# Altium project DAC.PrjPcb
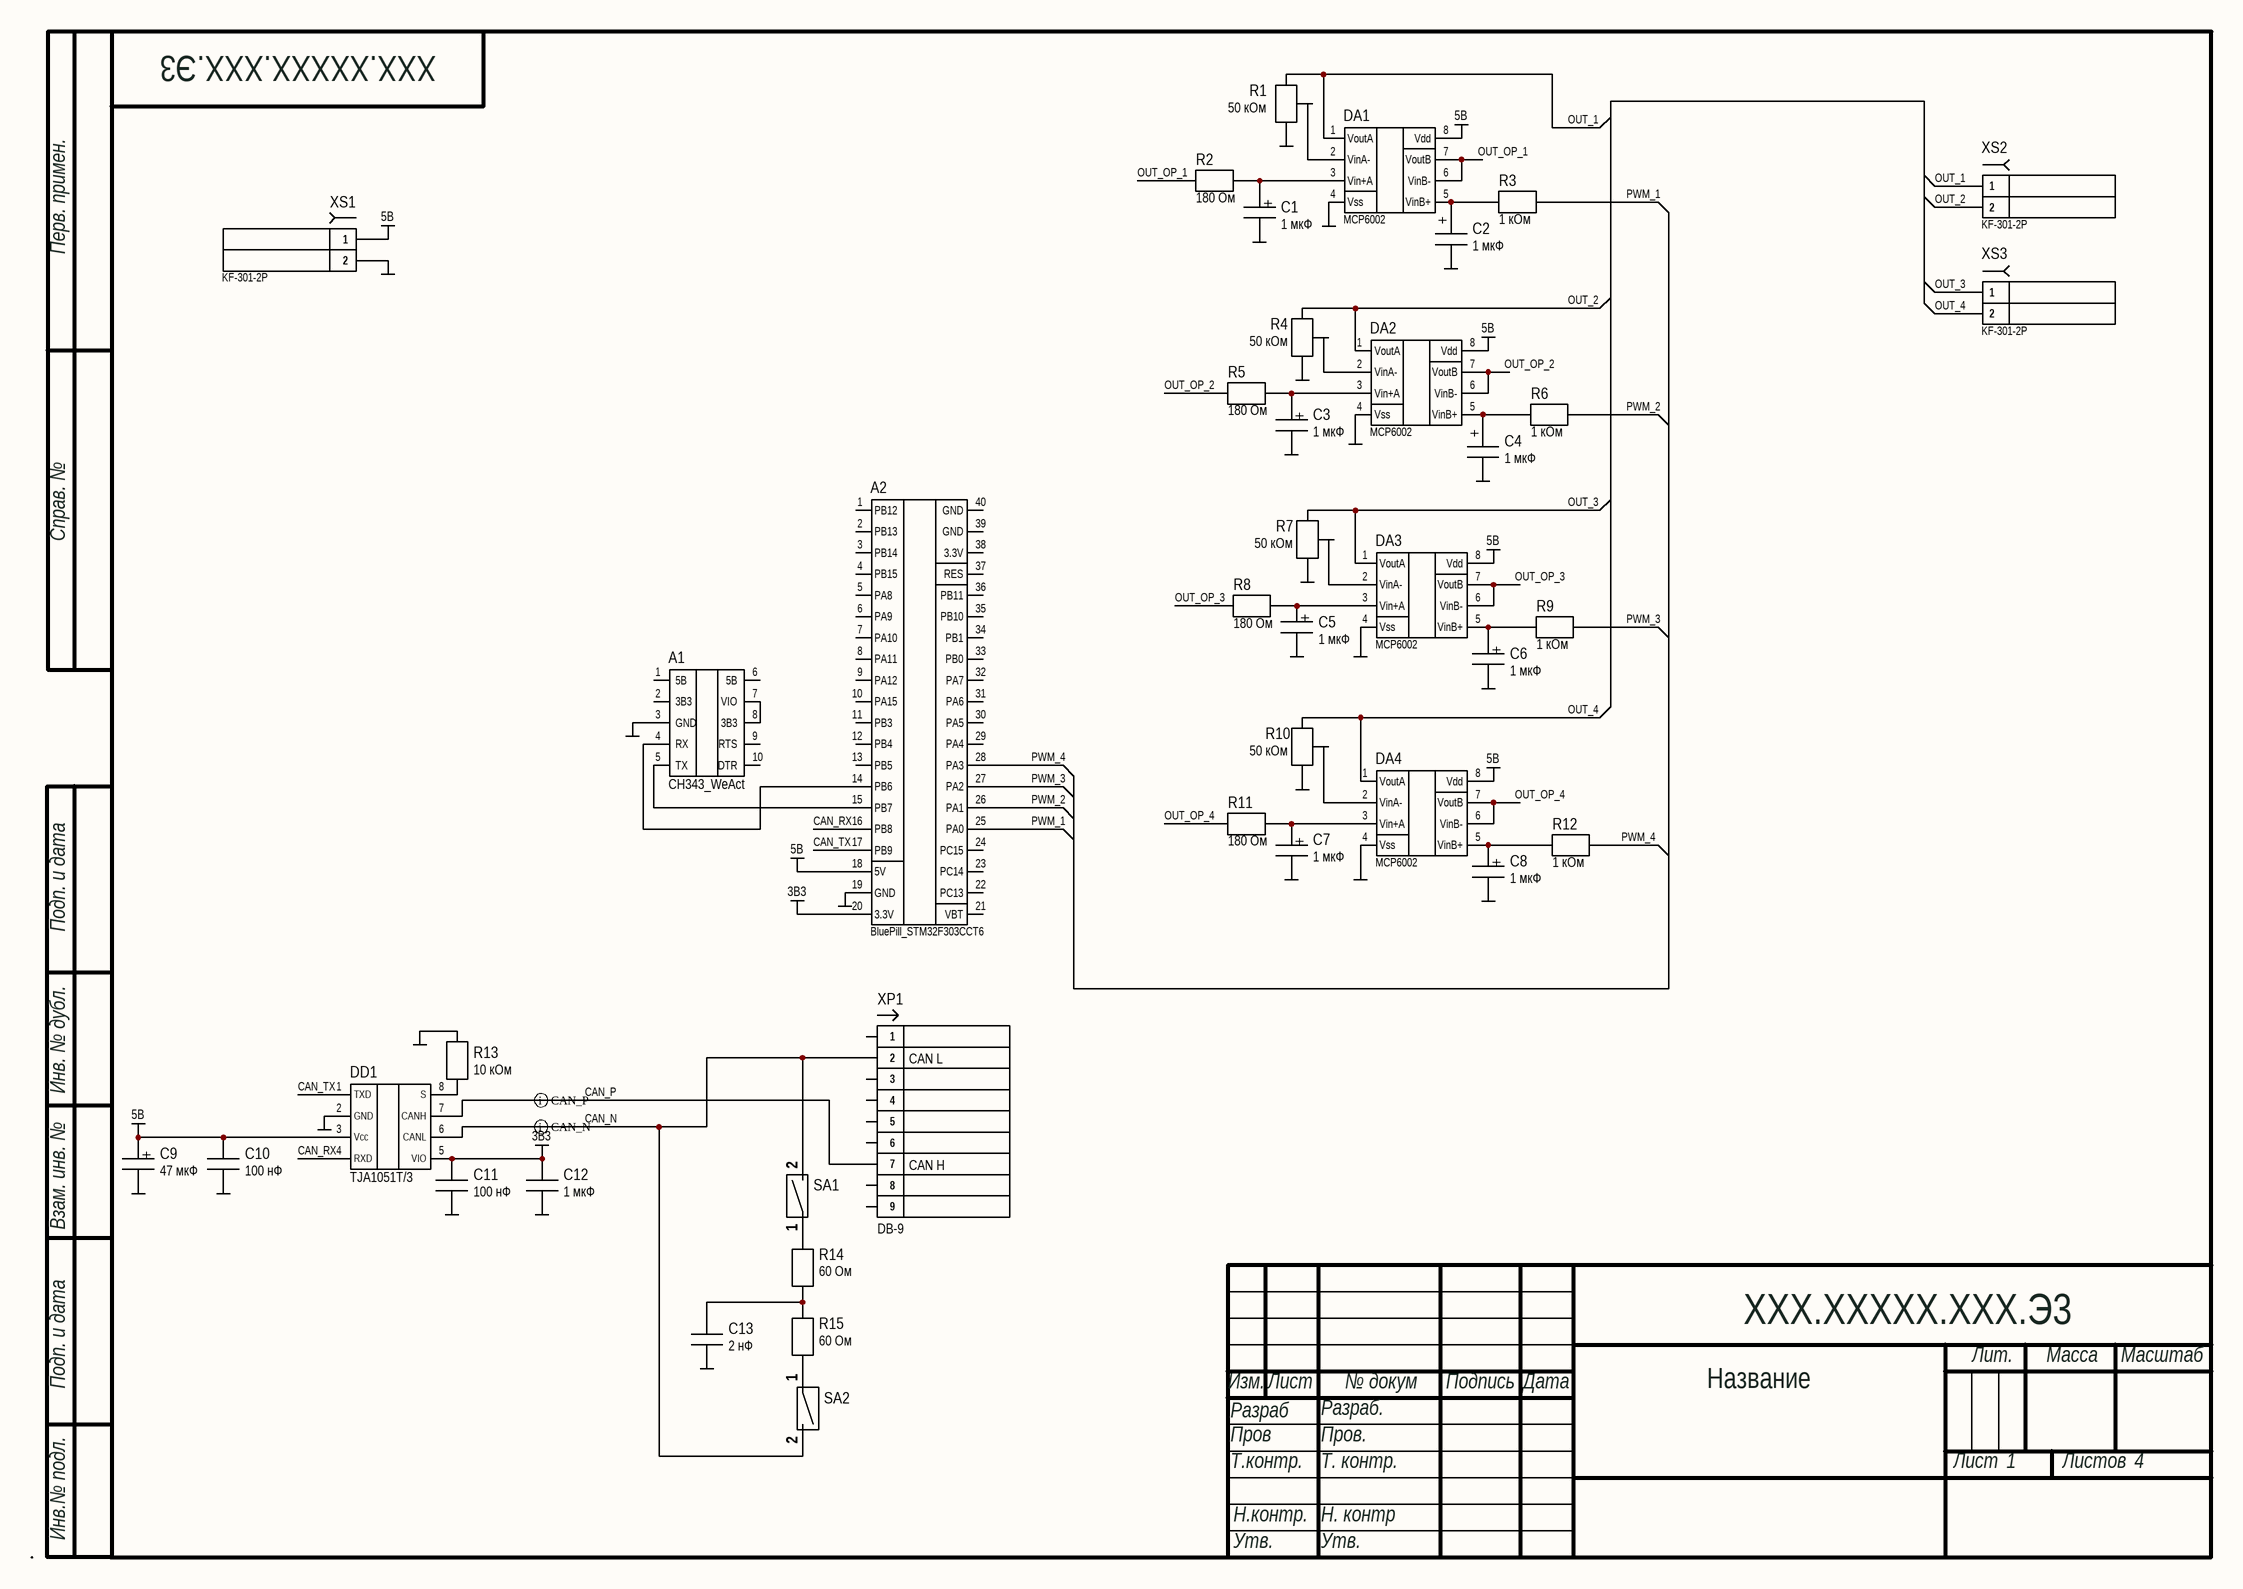
[diagram p0: DAC.SchDoc]
4 sheets, 41 parts. Net scope: global (net labels, ports and power ports of the same name join across sheets).
Board file: Шаблон проекта.PcbDoc
Sheets:
  DAC.SchDoc
  Шаблон проекта Л2.SchDoc
  Шаблон проекта Л3.SchDoc
  Шаблон проекта Л4.SchDoc

## Sheet DAC.SchDoc
size 420 x 297 mm; Разраб.: Разраб.; Пров.: Пров.; Т.контр.: Т. контр.; Н.контр.: Н. контр; Утв.: Утв.; Лист: 1; Листов: 4; Децим.  №: ХXX.XXXXX.XXX.Э3; Название: Название; Лист.: 1; Листов.: 1

### Parts
A1  CH343_WeAct
A2  BluePill_STM32F303CCT6
C1  1 мкФ  [capr- 2.5D6.5H12]
C2  1 мкФ  [capr- 2.5D6.5H12]
C3  1 мкФ  [capr- 2.5D6.5H12]
C4  1 мкФ  [capr- 2.5D6.5H12]
C5  1 мкФ  [capr- 2.5D6.5H12]
C6  1 мкФ  [capr- 2.5D6.5H12]
C7  1 мкФ  [capr- 2.5D6.5H12]
C8  1 мкФ  [capr- 2.5D6.5H12]
C9  47 мкФ  [Tant B]
C10  100 нФ  [CAP 0603 3D]
C11  100 нФ  [CAP 0603 3D]
C12  1 мкФ  [CAP 0603 3D]
C13  2 нФ  [CAP 0603 3D]
DA1  MCP6002  [SOIC-8 150mil]
DA2  MCP6002  [SOIC-8 150mil]
DA3  MCP6002  [SOIC-8 150mil]
DA4  MCP6002  [SOIC-8 150mil]
DD1  TJA1051T/3  [SOIC-8 150mil]
R1  50 кОм  [POT 3214 g]
R2  180 Ом  [RES 0.125  L 2.5]
R3  1 кОм  [RES 0.125  L 2.5]
R4  50 кОм  [POT 3266P]
R5  180 Ом  [RES 0.125  L 2.5]
R6  1 кОм  [RES 0.125  L 2.5]
R7  50 кОм  [POT 3266P]
R8  180 Ом  [RES 0.125  L 2.5]
R9  1 кОм  [RES 0.125  L 2.5]
R10  50 кОм  [POT 3266P]
R11  180 Ом  [RES 0.125  L 2.5]
R12  1 кОм  [RES 0.125  L 2.5]
R13  10 кОм  [RES 0.125  L 2.5]
R14  60 Ом  [RES 0.125  L 2.5]
R15  60 Ом  [RES 0.125  L 2.5]
SA1  SA x 1  [A6S1101(2,4)H]  (value not drawn)
SA2  SA x 1  [A6S1101(2,4)H]  (value not drawn)
XP1  DB-9  [KLS1-207-1*09]
XS1  KF-301-2P  [Degson_DG301-5.0-02P-1X]
XS2  KF-301-2P  [Degson_DG301-5.0-02P-1X]
XS3  KF-301-2P  [Degson_DG301-5.0-02P-1X]

### Nets
3В3: A2.20(3.3V) C11.1 C12.1 DD1.5(VIO)
5В: A2.18(5V) C9.1(+) C10.1 DA1.8(Vdd) DA2.8(Vdd) DA3.8(Vdd) DA4.8(Vdd) DD1.3(Vcc) XS1.1
GND: A1.3(GND) A2.19(GND) C1.1(-) C2.1(-) C3.1(-) C4.1(-) C5.1(-) C6.1(-) C7.1(-) C8.1(-) C9.2(-) C10.2 C11.2 C12.2 C13.2 DA1.4(Vss) DA2.4(Vss) DA3.4(Vss) DA4.4(Vss) DD1.2(GND) R1.3 R4.3 R7.3 R10.3 R13.2 XS1.2
CAN_N: DD1.6(CANL) SA1.2 SA2.2 XP1.2
CAN_P: DD1.7(CANH) XP1.7
CAN_RX: A2.16(PB8) DD1.4(RXD)
CAN_TX: A2.17(PB9) DD1.1(TXD)
OUT_1: DA1.1(VoutA) R1.1 XS2.1
OUT_2: DA2.1(VoutA) R4.1 XS2.2
OUT_3: DA3.1(VoutA) R7.1 XS3.1
OUT_4: DA4.1(VoutA) R10.1 XS3.2
OUT_OP_1: DA1.6(VinB-) DA1.7(VoutB) R2.1
OUT_OP_2: DA2.6(VinB-) DA2.7(VoutB) R5.1
OUT_OP_3: DA3.6(VinB-) DA3.7(VoutB) R8.1
OUT_OP_4: DA4.6(VinB-) DA4.7(VoutB) R11.1
PWM_1: A2.25(PA0) R3.1
PWM_2: A2.26(PA1) R6.1
PWM_3: A2.27(PA2) R9.2
PWM_4: A2.28(PA3) R12.2
NetA1_4: A1.4(RX) A2.14(PB6)
NetA1_5: A1.5(TX) A2.15(PB7)
NetA1_7: A1.7(VIO) A1.8(3В3)
NetC1_2: C1.2(+) DA1.3(Vin+A) R2.2
NetC2_2: C2.2(+) DA1.5(VinB+) R3.2
NetC3_2: C3.2(+) DA2.3(Vin+A) R5.2
NetC4_2: C4.2(+) DA2.5(VinB+) R6.2
NetC5_2: C5.2(+) DA3.3(Vin+A) R8.2
NetC6_2: C6.2(+) DA3.5(VinB+) R9.1
NetC7_2: C7.2(+) DA4.3(Vin+A) R11.2
NetC8_2: C8.2(+) DA4.5(VinB+) R12.1
NetC13_1: C13.1 R14.1 R15.2
NetDA1_2: DA1.2(VinA-) R1.2
NetDA2_2: DA2.2(VinA-) R4.2
NetDA3_2: DA3.2(VinA-) R7.2
NetDA4_2: DA4.2(VinA-) R10.2
NetDD1_8: DD1.8(S) R13.1
NetR14_2: R14.2 SA1.1
NetR15_1: R15.1 SA2.1

Not connected (* = marked no-connect by the designer): A1 1(5В) 2(3В3) 6(5В) 9(RTS) 10(DTR); A2 1(PB12) 2(PB13) 3(PB14) 4(PB15) 5(PA8) 6(PA9) 7(PA10) 8(PA11) 9(PA12) 10(PA15) 11(PB3) 12(PB4) 13(PB5) 21(VBT) 22(PC13) 23(PC14) 24(PC15) 29(PA4) 30(PA5) 31(PA6) 32(PA7) 33(PB0) 34(PB1) 35(PB10) 36(PB11) 37(RES) 38(3.3V) 39(GND) 40(GND); XP1 1 3 4 5 6 8 9

### Layout directives
differential pair: CAN_N, CAN_P

### Notes on the sheet
- (near XP1) CAN L
- (near XP1) CAN H
- Перв. примен.
- Справ. №
- Подп. и дата
- Инв. № дубл.
- Взам. инв. №
- Изм.
- Лист
- № докум
- Подпись
- Дата
- Лит.
- Масса
- Масштаб
- Разраб
- Пров
- Т.контр.
- Листов
- Инв.№ подл.
- Н.контр.
- Утв.

### Library data of the parts
A2 = BluePill
C1-C8 = C Al R: Конденсатор алюминиевый радиальный
C9 = C T: Конденсатор тантал
C10-C13 = C: Конденсатор керамика
DA1-DA4 = MCP602
R1 R4 R7 R10 = R POT: Потенциометр BOURNS
R2 R3 R5 R6 R8 R9 R11-R15 = R: Резисторы плёночные (SMD; МЛТ; С2-33Н; MP9xxx)
SA1 SA2 = 2_ SA x 1: DIP  SMD  переключатели
XP1 = Штырь 1* 9  (1): Разъём штыревой на плату 2.54мм 1х9 pin

## Sheet Шаблон проекта Л2.SchDoc
size 420 x 297 mm; Разраб.: Разраб.; Лист: 2; Листов: 4; Децим.  №: XXX.XXXXX.XXX.Э3

### Notes on the sheet
- Перв. примен.
- Справ. №
- Подп. и дата
- Инв. № дубл.
- Взам. инв. №
- Инв.№ подл.
- Лист
- Изм.
- № докум
- Подпись
- Дата

## Sheet Шаблон проекта Л3.SchDoc
size 420 x 297 mm; Разраб.: Разраб.; Лист: 3; Листов: 4; Децим.  №: XXX.XXXXX.XXX.Э3

### Notes on the sheet
- Перв. примен.
- Справ. №
- Подп. и дата
- Инв. № дубл.
- Взам. инв. №
- Инв.№ подл.
- Лист
- Изм.
- № докум
- Подпись
- Дата

## Sheet Шаблон проекта Л4.SchDoc
size 420 x 297 mm; Разраб.: Бурыкин; Лист: 4; Листов: 4; Децим.  №: XXX.XXXXX.XXX.Э3

### Notes on the sheet
- Перв. примен.
- Справ. №
- Подп. и дата
- Инв. № дубл.
- Взам. инв. №
- Инв.№ подл.
- Лист
- Изм.
- № докум
- Подпись
- Дата